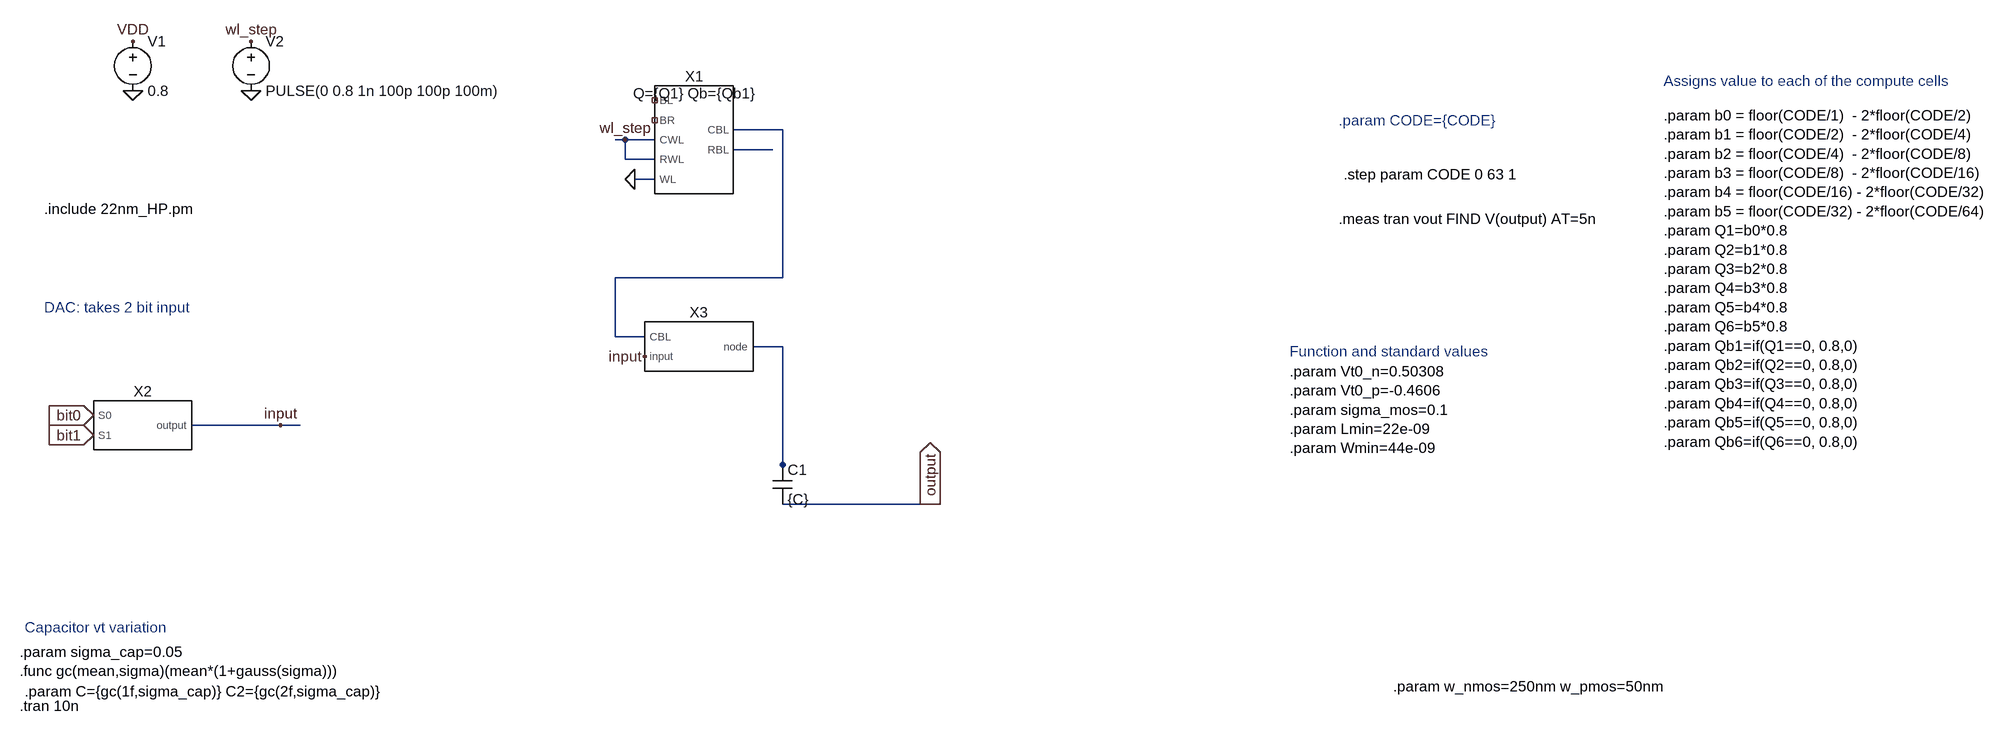
[diagram p0: schematic two_bit_weight_row.asc]
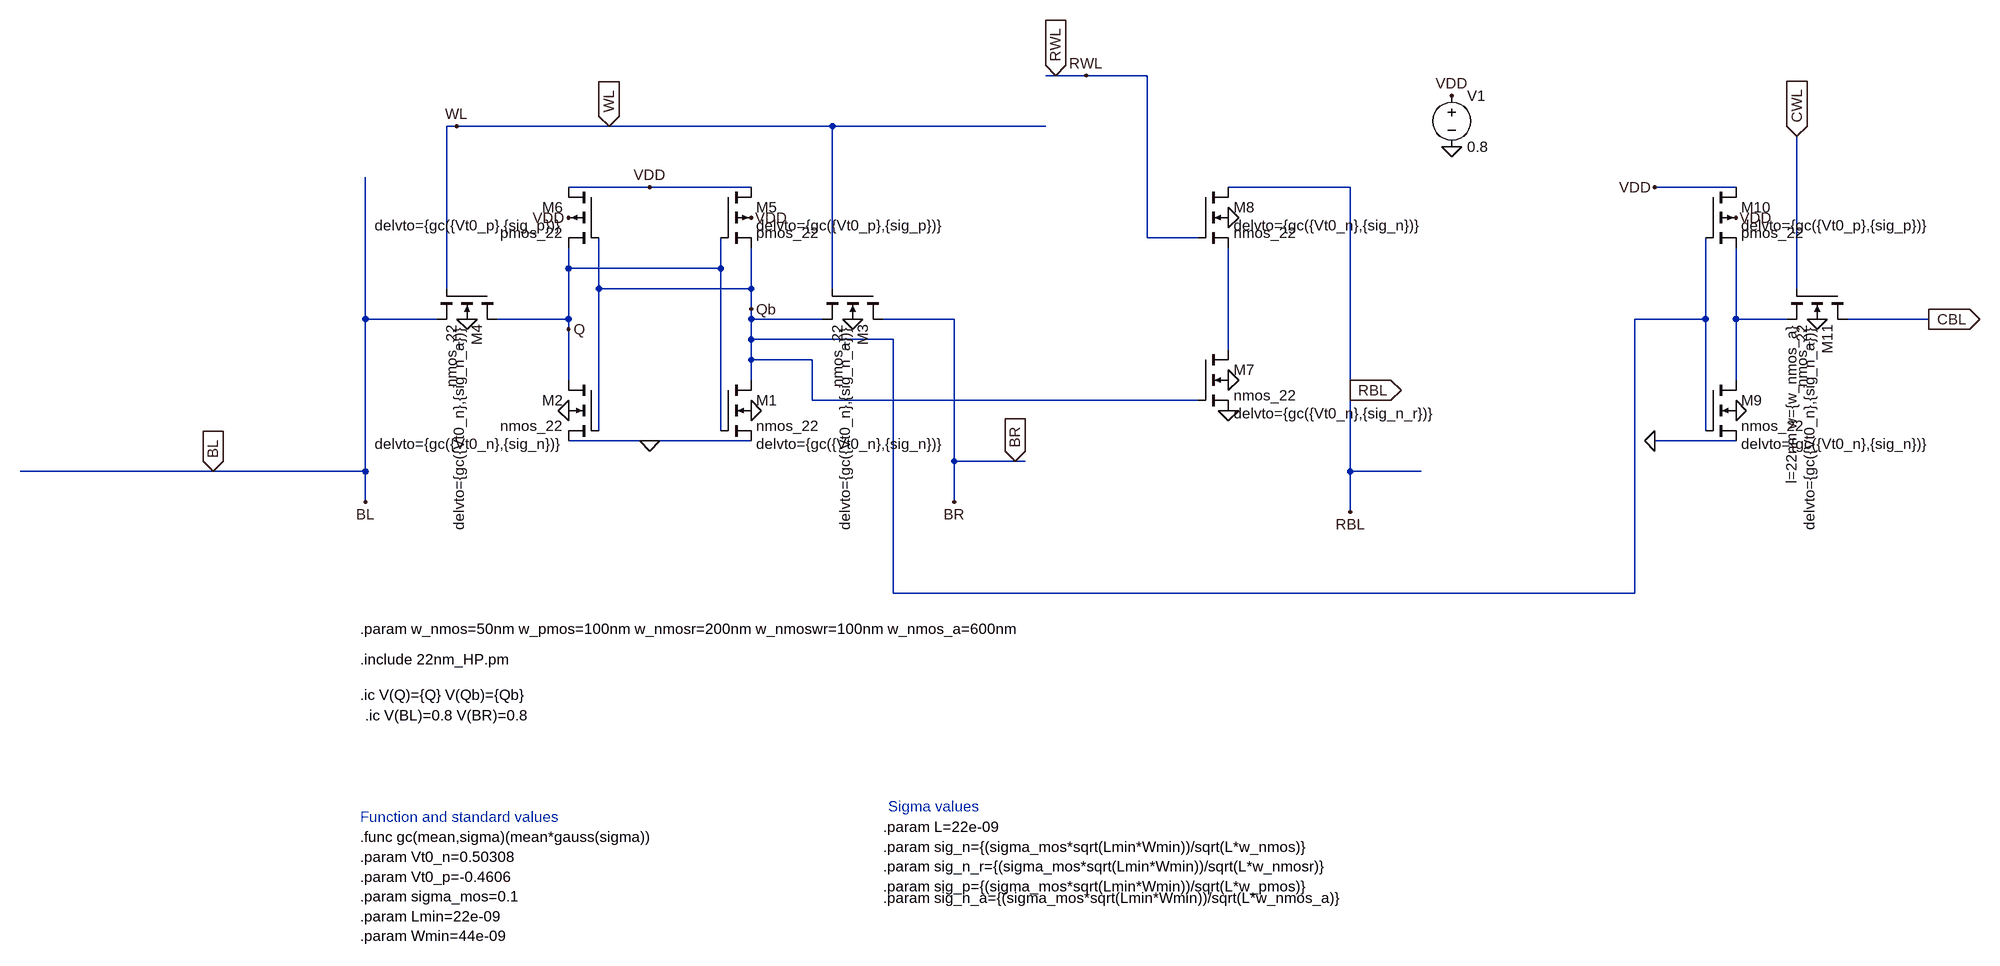
[diagram p1: sub-circuit vt_cell.asc]
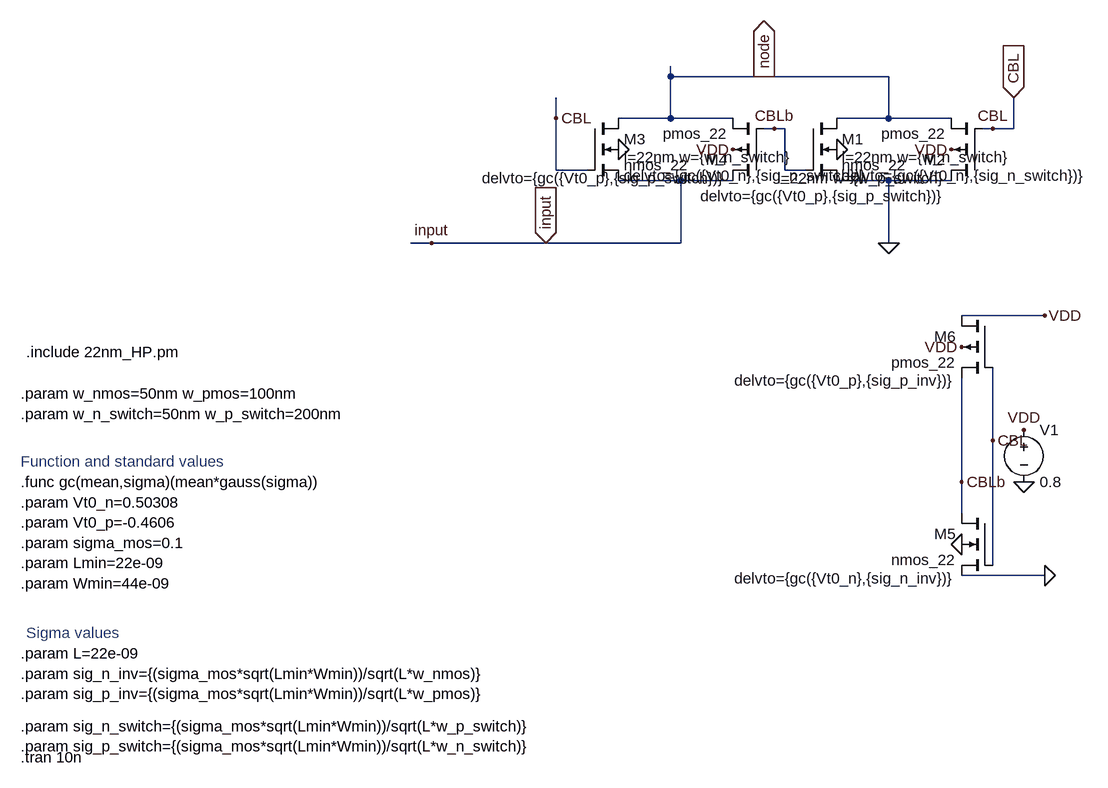
[diagram p2: sub-circuit transmissiongate_switch.asc]
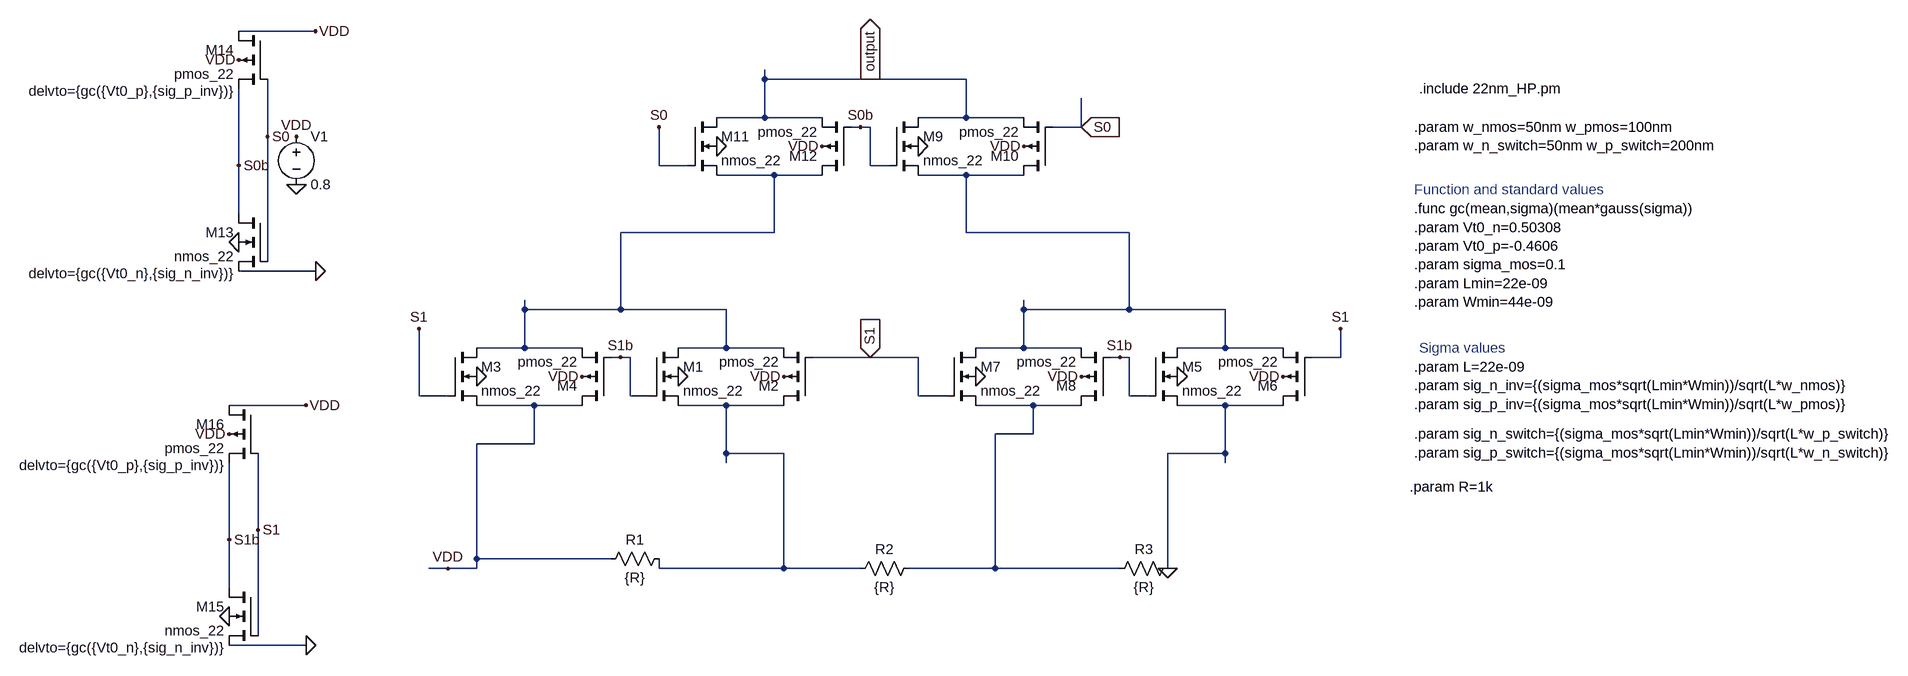
[diagram p3: sub-circuit dac.asc]
two_bit_weight_row.asc, the LTspice schematic file:
Version 4.1
SHEET 1 1952 760
WIRE -48 -192 -128 -192
WIRE -304 -176 -320 -176
WIRE -256 -176 -304 -176
WIRE -64 -160 -128 -160
WIRE -304 -144 -304 -176
WIRE -256 -144 -304 -144
WIRE -256 -112 -288 -112
WIRE -48 48 -48 -192
WIRE -48 48 -320 48
WIRE -320 144 -320 48
WIRE -272 144 -320 144
WIRE -48 160 -96 160
WIRE -864 288 -1008 288
WIRE -832 288 -864 288
WIRE -48 352 -48 160
WIRE -48 368 -48 352
WIRE 192 416 -48 416
WIRE 208 416 192 416
FLAG -288 -112 0
FLAG -304 -176 wl_step
FLAG -272 176 input
FLAG -912 -256 0
FLAG -912 -336 wl_step
FLAG -1104 -256 0
FLAG -1104 -336 VDD
FLAG 192 416 output
IOPIN 192 416 Out
FLAG -864 288 input
FLAG -1168 272 bit0
IOPIN -1168 272 In
FLAG -1168 304 bit1
IOPIN -1168 304 In
SYMBOL vt_cell -192 -176 R0
WINDOW 39 0 -60 Bottom 2
SYMATTR SpiceLine Q={Q1} Qb={Qb1}
SYMATTR InstName X1
SYMBOL transmissiongate_switch -192 160 R0
SYMATTR InstName X3
SYMBOL cap -64 416 M180
WINDOW 0 24 56 Left 2
WINDOW 3 24 8 Left 2
SYMATTR InstName C1
SYMATTR Value {C}
SYMBOL voltage -1104 -352 R0
WINDOW 123 0 0 Left 0
WINDOW 39 0 0 Left 0
SYMATTR InstName V1
SYMATTR Value 0.8
SYMBOL voltage -912 -352 R0
WINDOW 123 0 0 Left 0
WINDOW 39 0 0 Left 0
SYMATTR InstName V2
SYMATTR Value PULSE(0 0.8 1n 100p 100p 100m)
SYMBOL DAC -1088 288 R0
SYMATTR InstName X2
TEXT 1384 -216 Left 2 !.param b0 = floor(CODE/1)  - 2*floor(CODE/2)\n.param b1 = floor(CODE/2)  - 2*floor(CODE/4)\n.param b2 = floor(CODE/4)  - 2*floor(CODE/8)\n.param b3 = floor(CODE/8)  - 2*floor(CODE/16)\n.param b4 = floor(CODE/16) - 2*floor(CODE/32)\n.param b5 = floor(CODE/32) - 2*floor(CODE/64)\n.param Q1=b0*0.8\n.param Q2=b1*0.8\n.param Q3=b2*0.8\n.param Q4=b3*0.8\n.param Q5=b4*0.8\n.param Q6=b5*0.8\n.param Qb1=if(Q1==0, 0.8,0)\n.param Qb2=if(Q2==0, 0.8,0)\n.param Qb3=if(Q3==0, 0.8,0)\n.param Qb4=if(Q4==0, 0.8,0)\n.param Qb5=if(Q5==0, 0.8,0)\n.param Qb6=if(Q6==0, 0.8,0)
TEXT 856 -208 Left 2 ;.param CODE={CODE}
TEXT 1384 -272 Left 2 ;Assigns value to each of the compute cells
TEXT 864 -120 Left 2 !.step param CODE 0 63 1
TEXT 856 -48 Left 2 !.meas tran vout FIND V(output) AT=5n
TEXT -1248 96 Left 2 ;DAC: takes 2 bit input
TEXT -1280 720 Left 2 !.param C={gc(1f,sigma_cap)} C2={gc(2f,sigma_cap)}
TEXT -1248 -64 Left 2 !.include 22nm_HP.pm
TEXT -1288 656 Left 2 !.param sigma_cap=0.05\n.func gc(mean,sigma)(mean*(1+gauss(sigma)))
TEXT -1280 616 Left 2 ;Capacitor vt variation
TEXT 944 712 Left 2 !.param w_nmos=250nm w_pmos=50nm
TEXT 776 200 Left 2 !.param Vt0_n=0.50308\n.param Vt0_p=-0.4606\n.param sigma_mos=0.1\n.param Lmin=22e-09\n.param Wmin=44e-09
TEXT 776 168 Left 2 ;Function and standard values
TEXT -1288 744 Left 2 !.tran 10n

vt_cell.asc, the sub-circuit schematic file:
Version 4.1
SHEET 1 2080 848
WIRE 320 -528 304 -528
WIRE 368 -528 320 -528
WIRE 464 -528 368 -528
WIRE -624 -448 -640 -448
WIRE -384 -448 -624 -448
WIRE -32 -448 -384 -448
WIRE 304 -448 -32 -448
WIRE -320 -352 -448 -352
WIRE -160 -352 -320 -352
WIRE 784 -352 592 -352
WIRE 1392 -352 1264 -352
WIRE 464 -272 464 -528
WIRE 544 -272 464 -272
WIRE -448 -224 -448 -256
WIRE -208 -224 -208 -272
WIRE -208 -224 -448 -224
WIRE -640 -192 -640 -448
WIRE -400 -192 -400 -272
WIRE -160 -192 -160 -256
WIRE -160 -192 -400 -192
WIRE -32 -192 -32 -448
WIRE 1488 -192 1488 -432
WIRE -160 -160 -160 -192
WIRE -768 -144 -768 -368
WIRE -656 -144 -768 -144
WIRE -448 -144 -448 -224
WIRE -448 -144 -560 -144
WIRE -160 -144 -160 -160
WIRE -48 -144 -160 -144
WIRE 160 -144 48 -144
WIRE 1344 -144 1344 -272
WIRE 1344 -144 1232 -144
WIRE 1392 -144 1392 -256
WIRE 1472 -144 1392 -144
WIRE 1696 -144 1568 -144
WIRE -448 -128 -448 -144
WIRE -160 -112 -160 -144
WIRE 64 -112 -160 -112
WIRE 592 -96 592 -256
WIRE -160 -80 -160 -112
WIRE -64 -80 -160 -80
WIRE -448 -48 -448 -128
WIRE -160 -48 -160 -80
WIRE 1392 -48 1392 -144
WIRE 784 -32 784 -352
WIRE -64 -16 -64 -80
WIRE 544 -16 -64 -16
WIRE -400 32 -400 -192
WIRE -208 32 -208 -224
WIRE 1344 32 1344 -144
WIRE -320 48 -448 48
WIRE -160 48 -320 48
WIRE 1392 48 1264 48
WIRE 160 80 160 -144
WIRE 256 80 160 80
WIRE 272 80 256 80
WIRE -1008 96 -1312 96
WIRE -768 96 -768 -144
WIRE -768 96 -1008 96
WIRE 784 96 784 -32
WIRE 896 96 784 96
WIRE -768 144 -768 96
WIRE 160 144 160 80
WIRE 784 160 784 96
WIRE 64 288 64 -112
WIRE 1232 288 1232 -144
WIRE 1232 288 64 288
FLAG 944 -416 0
FLAG 944 -496 VDD
FLAG -320 -352 VDD
FLAG -448 -304 VDD
FLAG -160 -304 VDD
FLAG 0 -144 0
FLAG -160 0 0
FLAG -448 0 0
FLAG -608 -144 0
FLAG -768 144 BL
FLAG 160 144 BR
FLAG -624 -448 WL
FLAG 592 -48 0
FLAG 592 -304 0
FLAG 368 -528 RWL
FLAG 784 160 RBL
FLAG -160 -160 Qb
FLAG -448 -128 Q
FLAG 592 0 0
FLAG -320 48 0
FLAG -384 -448 WL
IOPIN -384 -448 In
FLAG 320 -528 RWL
IOPIN 320 -528 In
FLAG 784 -32 RBL
IOPIN 784 -32 Out
FLAG 1264 -352 VDD
FLAG 1392 -304 VDD
FLAG 1392 0 0
FLAG 1264 48 0
FLAG 1520 -144 0
FLAG 1488 -432 CWL
IOPIN 1488 -432 In
FLAG 1696 -144 CBL
IOPIN 1696 -144 Out
FLAG -1008 96 BL
IOPIN -1008 96 In
FLAG 256 80 BR
IOPIN 256 80 In
SYMBOL nmos4 -208 -48 R0
WINDOW 39 56 100 Left 2
SYMATTR SpiceLine delvto={gc({Vt0_n},{sig_n})}
SYMATTR InstName M1
SYMATTR Value nmos_22
SYMATTR Value2 l=22nm w={w_nmos}
SYMBOL nmos4 -400 -48 M0
WINDOW 39 56 100 Left 2
SYMATTR SpiceLine delvto={gc({Vt0_n},{sig_n})}
SYMATTR InstName M2
SYMATTR Value nmos_22
SYMATTR Value2 l=22nm w={w_nmos}
SYMBOL nmos4 48 -192 R90
WINDOW 39 56 60 Left 2
SYMATTR SpiceLine delvto={gc({Vt0_n},{sig_n_a})}
SYMATTR InstName M3
SYMATTR Value nmos_22
SYMATTR Value2 l=22nm w={w_nmos_a}
SYMBOL nmos4 -560 -192 R90
WINDOW 39 56 60 Left 2
SYMATTR SpiceLine delvto={gc({Vt0_n},{sig_n_a})}
SYMATTR InstName M4
SYMATTR Value nmos_22
SYMATTR Value2 l=22nm w={w_nmos_a}
SYMBOL pmos4 -208 -352 R0
WINDOW 39 56 60 Left 2
SYMATTR SpiceLine delvto={gc({Vt0_p},{sig_p})}
SYMATTR InstName M5
SYMATTR Value pmos_22
SYMATTR Value2 l=22nm w={w_pmos}
SYMBOL pmos4 -400 -352 M0
WINDOW 39 56 60 Left 2
SYMATTR SpiceLine delvto={gc({Vt0_p},{sig_p})}
SYMATTR InstName M6
SYMATTR Value pmos_22
SYMATTR Value2 l=22nm w={w_pmos}
SYMBOL voltage 944 -512 R0
WINDOW 123 0 0 Left 0
WINDOW 39 0 0 Left 0
SYMATTR InstName V1
SYMATTR Value 0.8
SYMBOL nmos4 544 -96 R0
WINDOW 39 56 100 Left 2
SYMATTR SpiceLine delvto={gc({Vt0_n},{sig_n_r})}
SYMATTR InstName M7
SYMATTR Value nmos_22
SYMATTR Value2 l=22nm w={w_nmosr}
SYMBOL nmos4 544 -352 R0
WINDOW 39 56 60 Left 2
SYMATTR SpiceLine delvto={gc({Vt0_n},{sig_n})}
SYMATTR InstName M8
SYMATTR Value nmos_22
SYMATTR Value2 l=22nm w={w_nmos}
SYMBOL nmos4 1344 -48 R0
WINDOW 39 56 100 Left 2
SYMATTR SpiceLine delvto={gc({Vt0_n},{sig_n})}
SYMATTR InstName M9
SYMATTR Value nmos_22
SYMATTR Value2 l=22nm w={w_nmos}
SYMBOL pmos4 1344 -352 R0
WINDOW 39 56 60 Left 2
SYMATTR SpiceLine delvto={gc({Vt0_p},{sig_p})}
SYMATTR InstName M10
SYMATTR Value pmos_22
SYMATTR Value2 l=22nm w={w_pmos}
SYMBOL nmos4 1568 -192 R90
WINDOW 39 56 60 Left 2
WINDOW 123 56 88 Left 2
SYMATTR SpiceLine delvto={gc({Vt0_n},{sig_n_a})}
SYMATTR Value2 l=22nm w={w_nmos_a}
SYMATTR InstName M11
SYMATTR Value nmos_22
TEXT -776 392 Left 2 !.include 22nm_HP.pm
TEXT -776 344 Left 2 !.param w_nmos=50nm w_pmos=100nm w_nmosr=200nm w_nmoswr=100nm w_nmos_a=600nm
TEXT -776 448 Left 2 !.ic V(Q)={Q} V(Qb)={Qb}
TEXT -776 672 Left 2 !.func gc(mean,sigma)(mean*gauss(sigma))\n.param Vt0_n=0.50308\n.param Vt0_p=-0.4606\n.param sigma_mos=0.1\n.param Lmin=22e-09\n.param Wmin=44e-09
TEXT 48 656 Left 2 !.param L=22e-09\n.param sig_n={(sigma_mos*sqrt(Lmin*Wmin))/sqrt(L*w_nmos)}\n.param sig_n_r={(sigma_mos*sqrt(Lmin*Wmin))/sqrt(L*w_nmosr)}\n.param sig_p={(sigma_mos*sqrt(Lmin*Wmin))/sqrt(L*w_pmos)}
TEXT -776 640 Left 2 ;Function and standard values
TEXT 56 624 Left 2 ;Sigma values
TEXT -768 480 Left 2 !.ic V(BL)=0.8 V(BR)=0.8
TEXT 48 768 Left 2 !.param sig_n_a={(sigma_mos*sqrt(Lmin*Wmin))/sqrt(L*w_nmos_a)}

transmissiongate_switch.asc, the sub-circuit schematic file:
Version 4.1
SHEET 1 888 868
WIRE 128 -240 128 -256
WIRE 272 -240 128 -240
WIRE 464 -240 272 -240
WIRE -48 -176 -48 -208
WIRE 128 -176 128 -240
WIRE 128 -176 48 -176
WIRE 224 -176 128 -176
WIRE 464 -176 464 -240
WIRE 464 -176 384 -176
WIRE 560 -176 464 -176
WIRE 288 -160 272 -160
WIRE 304 -160 288 -160
WIRE 624 -160 608 -160
WIRE 656 -160 656 -208
WIRE 656 -160 624 -160
WIRE -48 -96 -48 -176
WIRE 0 -96 -48 -96
WIRE 304 -96 304 -160
WIRE 336 -96 304 -96
WIRE 144 -80 48 -80
WIRE 224 -80 144 -80
WIRE 464 -80 384 -80
WIRE 560 -80 464 -80
WIRE -240 16 -272 16
WIRE -64 16 -240 16
WIRE 144 16 144 -80
WIRE 144 16 -64 16
WIRE 464 16 464 -80
WIRE 704 128 576 128
WIRE 624 320 624 208
WIRE 576 384 576 224
WIRE 576 432 576 384
WIRE 624 512 624 320
WIRE 704 528 576 528
FLAG 384 -128 0
FLAG 560 -128 VDD
FLAG 48 -128 0
FLAG 224 -128 VDD
FLAG 464 16 0
FLAG -240 16 input
FLAG 704 128 VDD
FLAG 576 176 VDD
FLAG 576 480 0
FLAG 704 528 0
FLAG 656 -208 CBL
IOPIN 656 -208 In
FLAG 624 -160 CBL
FLAG 624 320 CBL
FLAG -48 -176 CBL
FLAG 576 384 CBLb
FLAG 288 -160 CBLb
FLAG -64 16 input
IOPIN -64 16 In
FLAG 272 -240 node
IOPIN 272 -240 Out
FLAG 672 384 0
FLAG 672 304 VDD
SYMBOL nmos4 336 -176 R0
WINDOW 123 56 60 Left 2
WINDOW 39 56 88 Left 2
SYMATTR Value2 l=22nm w={w_n_switch}
SYMATTR SpiceLine delvto={gc({Vt0_n},{sig_n_switch})}
SYMATTR InstName M1
SYMATTR Value nmos_22
SYMBOL pmos4 608 -80 R180
WINDOW 123 56 4 Left 2
WINDOW 39 56 -24 Left 2
SYMATTR Value2 l=22nm w={w_p_switch}
SYMATTR SpiceLine delvto={gc({Vt0_p},{sig_p_switch})}
SYMATTR InstName M2
SYMATTR Value pmos_22
SYMBOL nmos4 0 -176 R0
WINDOW 123 56 60 Left 2
WINDOW 39 56 88 Left 2
SYMATTR Value2 l=22nm w={w_n_switch}
SYMATTR SpiceLine delvto={gc({Vt0_n},{sig_n_switch})}
SYMATTR InstName M3
SYMATTR Value nmos_22
SYMBOL pmos4 272 -80 R180
WINDOW 39 56 4 Left 2
SYMATTR SpiceLine delvto={gc({Vt0_p},{sig_p_switch})}
SYMATTR InstName M4
SYMATTR Value pmos_22
SYMATTR Value2 l=22nm w={w_p_switch}
SYMBOL nmos4 624 432 M0
WINDOW 39 56 100 Left 2
SYMATTR SpiceLine delvto={gc({Vt0_n},{sig_n_inv})}
SYMATTR InstName M5
SYMATTR Value nmos_22
SYMATTR Value2 l=22nm w={w_nmos}
SYMBOL pmos4 624 128 M0
WINDOW 39 56 100 Left 2
SYMATTR SpiceLine delvto={gc({Vt0_p},{sig_p_inv})}
SYMATTR InstName M6
SYMATTR Value pmos_22
SYMATTR Value2 l=22nm w={w_pmos}
SYMBOL voltage 672 288 R0
WINDOW 123 0 0 Left 0
WINDOW 39 0 0 Left 0
SYMATTR InstName V1
SYMATTR Value 0.8
TEXT -872 248 Left 2 !.param w_nmos=50nm w_pmos=100nm\n.param w_n_switch=50nm w_p_switch=200nm
TEXT -872 384 Left 2 !.func gc(mean,sigma)(mean*gauss(sigma))\n.param Vt0_n=0.50308\n.param Vt0_p=-0.4606\n.param sigma_mos=0.1\n.param Lmin=22e-09\n.param Wmin=44e-09
TEXT -872 648 Left 2 !.param L=22e-09\n.param sig_n_inv={(sigma_mos*sqrt(Lmin*Wmin))/sqrt(L*w_nmos)}\n.param sig_p_inv={(sigma_mos*sqrt(Lmin*Wmin))/sqrt(L*w_pmos)}
TEXT -872 352 Left 2 ;Function and standard values
TEXT -864 616 Left 2 ;Sigma values
TEXT -872 760 Left 2 !.param sig_n_switch={(sigma_mos*sqrt(Lmin*Wmin))/sqrt(L*w_p_switch)}\n.param sig_p_switch={(sigma_mos*sqrt(Lmin*Wmin))/sqrt(L*w_n_switch)}
TEXT -872 808 Left 2 !.tran 10n
TEXT -864 184 Left 2 !.include 22nm_HP.pm

dac.asc, the sub-circuit schematic file:
Version 4.1
SHEET 1 2632 1040
WIRE -528 -384 -656 -384
WIRE 352 -304 352 -320
WIRE 528 -304 352 -304
WIRE 688 -304 528 -304
WIRE 352 -240 352 -304
WIRE 352 -240 272 -240
WIRE 448 -240 352 -240
WIRE 688 -240 688 -304
WIRE 688 -240 608 -240
WIRE 784 -240 688 -240
WIRE 512 -224 496 -224
WIRE 528 -224 512 -224
WIRE 880 -224 880 -272
WIRE 880 -224 832 -224
WIRE -608 -208 -608 -304
WIRE -656 -160 -656 -288
WIRE 176 -160 176 -224
WIRE 224 -160 176 -160
WIRE 528 -160 528 -224
WIRE 560 -160 528 -160
WIRE 368 -144 272 -144
WIRE 448 -144 368 -144
WIRE 688 -144 608 -144
WIRE 784 -144 688 -144
WIRE -656 -80 -656 -160
WIRE 368 -48 368 -144
WIRE 368 -48 112 -48
WIRE 688 -48 688 -144
WIRE 960 -48 688 -48
WIRE -608 0 -608 -208
WIRE -528 16 -656 16
WIRE -48 80 -48 64
WIRE 112 80 112 -48
WIRE 112 80 -48 80
WIRE 288 80 112 80
WIRE 784 80 784 64
WIRE 960 80 960 -48
WIRE 960 80 784 80
WIRE 1120 80 960 80
WIRE -48 144 -48 80
WIRE -48 144 -128 144
WIRE 48 144 -48 144
WIRE 288 144 288 80
WIRE 288 144 208 144
WIRE 384 144 288 144
WIRE 784 144 784 80
WIRE 784 144 704 144
WIRE 880 144 784 144
WIRE 1120 144 1120 80
WIRE 1120 144 1040 144
WIRE 1216 144 1120 144
WIRE 112 160 96 160
WIRE 128 160 112 160
WIRE 528 160 432 160
WIRE 608 160 528 160
WIRE 944 160 928 160
WIRE 960 160 944 160
WIRE 1312 160 1312 112
WIRE 1312 160 1264 160
WIRE -224 224 -224 112
WIRE -176 224 -224 224
WIRE 128 224 128 160
WIRE 160 224 128 224
WIRE 608 224 608 160
WIRE 656 224 608 224
WIRE 960 224 960 160
WIRE 992 224 960 224
WIRE -544 240 -672 240
WIRE -32 240 -128 240
WIRE 48 240 -32 240
WIRE 288 240 208 240
WIRE 384 240 288 240
WIRE 800 240 704 240
WIRE 880 240 800 240
WIRE 1120 240 1040 240
WIRE 1216 240 1120 240
WIRE 800 288 800 240
WIRE 800 288 736 288
WIRE -32 304 -32 240
WIRE -32 304 -128 304
WIRE 288 320 288 240
WIRE 384 320 288 320
WIRE 1120 320 1120 240
WIRE 1120 320 1024 320
WIRE 288 336 288 320
WIRE 1120 336 1120 320
WIRE -624 448 -624 320
WIRE -672 464 -672 336
WIRE -128 496 -128 304
WIRE 96 496 -128 496
WIRE -176 512 -208 512
WIRE -128 512 -128 496
WIRE -128 512 -176 512
WIRE 176 512 176 496
WIRE 384 512 384 320
WIRE 384 512 176 512
WIRE 512 512 384 512
WIRE 736 512 736 288
WIRE 736 512 592 512
WIRE 944 512 736 512
WIRE 1024 512 1024 320
WIRE -672 544 -672 464
WIRE -624 624 -624 448
WIRE -544 640 -672 640
FLAG 208 192 0
FLAG 384 192 VDD
FLAG -128 192 0
FLAG 48 192 VDD
FLAG 1040 192 0
FLAG 1216 192 VDD
FLAG 704 192 0
FLAG 880 192 VDD
FLAG 608 -192 0
FLAG 784 -192 VDD
FLAG 272 -192 0
FLAG 448 -192 VDD
FLAG 880 -224 S0
IOPIN 880 -224 In
FLAG 528 160 S1
IOPIN 528 160 In
FLAG -528 -384 VDD
FLAG -656 -336 VDD
FLAG -656 -32 0
FLAG -528 16 0
FLAG -560 -128 0
FLAG -560 -208 VDD
FLAG -544 240 VDD
FLAG -672 288 VDD
FLAG -672 592 0
FLAG -544 640 0
FLAG -608 -208 S0
FLAG -656 -160 S0b
FLAG -672 464 S1b
FLAG -624 448 S1
FLAG 1024 512 0
FLAG 528 -304 output
IOPIN 528 -304 Out
FLAG 176 -224 S0
FLAG 512 -224 S0b
FLAG -224 112 S1
FLAG 1312 112 S1
FLAG 944 160 S1b
FLAG 112 160 S1b
FLAG -176 512 VDD
SYMBOL nmos4 160 144 R0
SYMATTR Value2 l=22nm w={w_n_switch} delvto={gc({Vt0_n},{sig_n_switch})}
SYMATTR InstName M1
SYMATTR Value nmos_22
SYMBOL pmos4 432 240 R180
SYMATTR Value2 l=22nm w={w_p_switch} delvto={gc({Vt0_p},{sig_p_switch})}
SYMATTR InstName M2
SYMATTR Value pmos_22
SYMBOL nmos4 -176 144 R0
SYMATTR Value2 l=22nm w={w_n_switch} delvto={gc({Vt0_n},{sig_n_switch})}
SYMATTR InstName M3
SYMATTR Value nmos_22
SYMBOL pmos4 96 240 R180
SYMATTR InstName M4
SYMATTR Value pmos_22
SYMATTR Value2 l=22nm w={w_p_switch} delvto={gc({Vt0_p},{sig_p_switch})}
SYMBOL nmos4 992 144 R0
SYMATTR Value2 l=22nm w={w_n_switch} delvto={gc({Vt0_n},{sig_n_switch})}
SYMATTR InstName M5
SYMATTR Value nmos_22
SYMBOL pmos4 1264 240 R180
SYMATTR Value2 l=22nm w={w_p_switch} delvto={gc({Vt0_p},{sig_p_switch})}
SYMATTR InstName M6
SYMATTR Value pmos_22
SYMBOL nmos4 656 144 R0
SYMATTR Value2 l=22nm w={w_n_switch} delvto={gc({Vt0_n},{sig_n_switch})}
SYMATTR InstName M7
SYMATTR Value nmos_22
SYMBOL pmos4 928 240 R180
SYMATTR InstName M8
SYMATTR Value pmos_22
SYMATTR Value2 l=22nm w={w_p_switch} delvto={gc({Vt0_p},{sig_p_switch})}
SYMBOL nmos4 560 -240 R0
SYMATTR Value2 l=22nm w={w_n_switch} delvto={gc({Vt0_n},{sig_n_switch})}
SYMATTR InstName M9
SYMATTR Value nmos_22
SYMBOL pmos4 832 -144 R180
SYMATTR Value2 l=22nm w={w_p_switch} delvto={gc({Vt0_p},{sig_p_switch})}
SYMATTR InstName M10
SYMATTR Value pmos_22
SYMBOL nmos4 224 -240 R0
SYMATTR Value2 l=22nm w={w_n_switch} delvto={gc({Vt0_n},{sig_n_switch})}
SYMATTR InstName M11
SYMATTR Value nmos_22
SYMBOL pmos4 496 -144 R180
SYMATTR InstName M12
SYMATTR Value pmos_22
SYMATTR Value2 l=22nm w={w_p_switch} delvto={gc({Vt0_p},{sig_p_switch})}
SYMBOL nmos4 -608 -80 M0
WINDOW 39 56 100 Left 2
SYMATTR SpiceLine delvto={gc({Vt0_n},{sig_n_inv})}
SYMATTR InstName M13
SYMATTR Value nmos_22
SYMATTR Value2 l=22nm w={w_nmos}
SYMBOL pmos4 -608 -384 M0
WINDOW 39 56 100 Left 2
SYMATTR SpiceLine delvto={gc({Vt0_p},{sig_p_inv})}
SYMATTR InstName M14
SYMATTR Value pmos_22
SYMATTR Value2 l=22nm w={w_pmos}
SYMBOL voltage -560 -224 R0
WINDOW 123 0 0 Left 0
WINDOW 39 0 0 Left 0
SYMATTR InstName V1
SYMATTR Value 0.8
SYMBOL nmos4 -624 544 M0
WINDOW 39 56 100 Left 2
SYMATTR SpiceLine delvto={gc({Vt0_n},{sig_n_inv})}
SYMATTR InstName M15
SYMATTR Value nmos_22
SYMATTR Value2 l=22nm w={w_nmos}
SYMBOL pmos4 -624 240 M0
WINDOW 39 56 100 Left 2
SYMATTR SpiceLine delvto={gc({Vt0_p},{sig_p_inv})}
SYMATTR InstName M16
SYMATTR Value pmos_22
SYMATTR Value2 l=22nm w={w_pmos}
SYMBOL res 192 480 R90
WINDOW 0 0 56 VBottom 2
WINDOW 3 32 56 VTop 2
SYMATTR InstName R1
SYMATTR Value {R}
SYMBOL res 608 496 R90
WINDOW 0 0 56 VBottom 2
WINDOW 3 32 56 VTop 2
SYMATTR InstName R2
SYMATTR Value {R}
SYMBOL res 1040 496 R90
WINDOW 0 0 56 VBottom 2
WINDOW 3 32 56 VTop 2
SYMATTR InstName R3
SYMATTR Value {R}
TEXT 1712 376 Left 2 !.param R=1k
TEXT 1720 -224 Left 2 !.param w_nmos=50nm w_pmos=100nm\n.param w_n_switch=50nm w_p_switch=200nm
TEXT 1720 -88 Left 2 !.func gc(mean,sigma)(mean*gauss(sigma))\n.param Vt0_n=0.50308\n.param Vt0_p=-0.4606\n.param sigma_mos=0.1\n.param Lmin=22e-09\n.param Wmin=44e-09
TEXT 1720 176 Left 2 !.param L=22e-09\n.param sig_n_inv={(sigma_mos*sqrt(Lmin*Wmin))/sqrt(L*w_nmos)}\n.param sig_p_inv={(sigma_mos*sqrt(Lmin*Wmin))/sqrt(L*w_pmos)}
TEXT 1720 -120 Left 2 ;Function and standard values
TEXT 1728 144 Left 2 ;Sigma values
TEXT 1720 288 Left 2 !.param sig_n_switch={(sigma_mos*sqrt(Lmin*Wmin))/sqrt(L*w_p_switch)}\n.param sig_p_switch={(sigma_mos*sqrt(Lmin*Wmin))/sqrt(L*w_n_switch)}
TEXT 1728 -288 Left 2 !.include 22nm_HP.pm

The netlist it stands for:
* two_bit_weight_row.asc
X§X1 NC_01 NC_02 wl_step wl_step 0 N001 N002 vt_cell params: Q={Q1} Qb={Qb1}
X§X3 N001 input N003 transmissiongate_switch
C1 output N003 {C}
V1 VDD 0 0.8
V2 wl_step 0 PULSE(0 0.8 1n 100p 100p 100m)
X§X2 bit0 bit1 input dac

* block symbol definitions
.subckt vt_cell BL BR CWL RWL WL CBL RBL
M1 Qb Q 0 0 nmos_22 l=22nm w={w_nmos} delvto={gc({Vt0_n},{sig_n})}
M2 Q Qb 0 0 nmos_22 l=22nm w={w_nmos} delvto={gc({Vt0_n},{sig_n})}
M3 BR WL Qb 0 nmos_22 l=22nm w={w_nmos_a} delvto={gc({Vt0_n},{sig_n_a})}
M4 Q WL BL 0 nmos_22 l=22nm w={w_nmos_a} delvto={gc({Vt0_n},{sig_n_a})}
M5 VDD Q Qb VDD pmos_22 l=22nm w={w_pmos} delvto={gc({Vt0_p},{sig_p})}
M6 VDD Qb Q VDD pmos_22 l=22nm w={w_pmos} delvto={gc({Vt0_p},{sig_p})}
V1 VDD 0 0.8
M7 N002 Qb 0 0 nmos_22 l=22nm w={w_nmosr} delvto={gc({Vt0_n},{sig_n_r})}
M8 RBL RWL N002 0 nmos_22 l=22nm w={w_nmos} delvto={gc({Vt0_n},{sig_n})}
M9 N001 Qb 0 0 nmos_22 l=22nm w={w_nmos} delvto={gc({Vt0_n},{sig_n})}
M10 VDD Qb N001 VDD pmos_22 l=22nm w={w_pmos} delvto={gc({Vt0_p},{sig_p})}
M11 CBL CWL N001 0 nmos_22 l=22nm w={w_nmos_a} delvto={gc({Vt0_n},{sig_n_a})}
.include 22nm_HP.pm
.param w_nmos=50nm w_pmos=100nm w_nmosr=200nm w_nmoswr=100nm w_nmos_a=600nm
.ic V(Q)={Q} V(Qb)={Qb}
.func gc(mean,sigma)(mean*gauss(sigma))
.param Vt0_n=0.50308
.param Vt0_p=-0.4606
.param sigma_mos=0.1
.param Lmin=22e-09
.param Wmin=44e-09
.param L=22e-09
.param sig_n={(sigma_mos*sqrt(Lmin*Wmin))/sqrt(L*w_nmos)}
.param sig_n_r={(sigma_mos*sqrt(Lmin*Wmin))/sqrt(L*w_nmosr)}
.param sig_p={(sigma_mos*sqrt(Lmin*Wmin))/sqrt(L*w_pmos)}
* Function and standard values
* Sigma values
.ic V(BL)=0.8 V(BR)=0.8
.param sig_n_a={(sigma_mos*sqrt(Lmin*Wmin))/sqrt(L*w_nmos_a)}
.ends vt_cell

.subckt transmissiongate_switch CBL input node
M1 node CBLb 0 0 nmos_22 l=22nm w={w_n_switch} delvto={gc({Vt0_n},{sig_n_switch})}
M2 0 CBL node VDD pmos_22 l=22nm w={w_p_switch} delvto={gc({Vt0_p},{sig_p_switch})}
M3 node CBL input 0 nmos_22 l=22nm w={w_n_switch} delvto={gc({Vt0_n},{sig_n_switch})}
M4 input CBLb node VDD pmos_22 l=22nm w={w_p_switch} delvto={gc({Vt0_p},{sig_p_switch})}
M5 CBLb CBL 0 0 nmos_22 l=22nm w={w_nmos} delvto={gc({Vt0_n},{sig_n_inv})}
M6 VDD CBL CBLb VDD pmos_22 l=22nm w={w_pmos} delvto={gc({Vt0_p},{sig_p_inv})}
V1 VDD 0 0.8
.param w_nmos=50nm w_pmos=100nm
.param w_n_switch=50nm w_p_switch=200nm
.func gc(mean,sigma)(mean*gauss(sigma))
.param Vt0_n=0.50308
.param Vt0_p=-0.4606
.param sigma_mos=0.1
.param Lmin=22e-09
.param Wmin=44e-09
.param L=22e-09
.param sig_n_inv={(sigma_mos*sqrt(Lmin*Wmin))/sqrt(L*w_nmos)}
.param sig_p_inv={(sigma_mos*sqrt(Lmin*Wmin))/sqrt(L*w_pmos)}
* Function and standard values
* Sigma values
.param sig_n_switch={(sigma_mos*sqrt(Lmin*Wmin))/sqrt(L*w_p_switch)}
.param sig_p_switch={(sigma_mos*sqrt(Lmin*Wmin))/sqrt(L*w_n_switch)}
.tran 10n
.include 22nm_HP.pm
.ends transmissiongate_switch

.subckt dac S0 S1 output
M1 N001 S1b N003 0 nmos_22 l=22nm w={w_n_switch} delvto={gc({Vt0_n},{sig_n_switch})}
M2 N003 S1 N001 VDD pmos_22 l=22nm w={w_p_switch} delvto={gc({Vt0_p},{sig_p_switch})}
M3 N001 S1 VDD 0 nmos_22 l=22nm w={w_n_switch} delvto={gc({Vt0_n},{sig_n_switch})}
M4 VDD S1b N001 VDD pmos_22 l=22nm w={w_p_switch} delvto={gc({Vt0_p},{sig_p_switch})}
M5 N002 S1b 0 0 nmos_22 l=22nm w={w_n_switch} delvto={gc({Vt0_n},{sig_n_switch})}
M6 0 S1 N002 VDD pmos_22 l=22nm w={w_p_switch} delvto={gc({Vt0_p},{sig_p_switch})}
M7 N002 S1 N004 0 nmos_22 l=22nm w={w_n_switch} delvto={gc({Vt0_n},{sig_n_switch})}
M8 N004 S1b N002 VDD pmos_22 l=22nm w={w_p_switch} delvto={gc({Vt0_p},{sig_p_switch})}
M9 output S0b N002 0 nmos_22 l=22nm w={w_n_switch} delvto={gc({Vt0_n},{sig_n_switch})}
M10 N002 S0 output VDD pmos_22 l=22nm w={w_p_switch} delvto={gc({Vt0_p},{sig_p_switch})}
M11 output S0 N001 0 nmos_22 l=22nm w={w_n_switch} delvto={gc({Vt0_n},{sig_n_switch})}
M12 N001 S0b output VDD pmos_22 l=22nm w={w_p_switch} delvto={gc({Vt0_p},{sig_p_switch})}
M13 S0b S0 0 0 nmos_22 l=22nm w={w_nmos} delvto={gc({Vt0_n},{sig_n_inv})}
M14 VDD S0 S0b VDD pmos_22 l=22nm w={w_pmos} delvto={gc({Vt0_p},{sig_p_inv})}
V1 VDD 0 0.8
M15 S1b S1 0 0 nmos_22 l=22nm w={w_nmos} delvto={gc({Vt0_n},{sig_n_inv})}
M16 VDD S1 S1b VDD pmos_22 l=22nm w={w_pmos} delvto={gc({Vt0_p},{sig_p_inv})}
R1 N003 VDD {R}
R2 N004 N003 {R}
R3 0 N004 {R}
.param R=1k
.param w_nmos=50nm w_pmos=100nm
.param w_n_switch=50nm w_p_switch=200nm
.func gc(mean,sigma)(mean*gauss(sigma))
.param Vt0_n=0.50308
.param Vt0_p=-0.4606
.param sigma_mos=0.1
.param Lmin=22e-09
.param Wmin=44e-09
.param L=22e-09
.param sig_n_inv={(sigma_mos*sqrt(Lmin*Wmin))/sqrt(L*w_nmos)}
.param sig_p_inv={(sigma_mos*sqrt(Lmin*Wmin))/sqrt(L*w_pmos)}
* Function and standard values
* Sigma values
.param sig_n_switch={(sigma_mos*sqrt(Lmin*Wmin))/sqrt(L*w_p_switch)}
.param sig_p_switch={(sigma_mos*sqrt(Lmin*Wmin))/sqrt(L*w_n_switch)}
.include 22nm_HP.pm
.ends dac

.model NMOS NMOS
.model PMOS PMOS
.lib standard.mos
.param b0 = floor(CODE/1)  - 2*floor(CODE/2)
.param b1 = floor(CODE/2)  - 2*floor(CODE/4)
.param b2 = floor(CODE/4)  - 2*floor(CODE/8)
.param b3 = floor(CODE/8)  - 2*floor(CODE/16)
.param b4 = floor(CODE/16) - 2*floor(CODE/32)
.param b5 = floor(CODE/32) - 2*floor(CODE/64)
.param Q1=b0*0.8
.param Q2=b1*0.8
.param Q3=b2*0.8
.param Q4=b3*0.8
.param Q5=b4*0.8
.param Q6=b5*0.8
.param Qb1=if(Q1==0, 0.8,0)
.param Qb2=if(Q2==0, 0.8,0)
.param Qb3=if(Q3==0, 0.8,0)
.param Qb4=if(Q4==0, 0.8,0)
.param Qb5=if(Q5==0, 0.8,0)
.param Qb6=if(Q6==0, 0.8,0)
* .param CODE={CODE}
* Assigns value to each of the compute cells
.step param CODE 0 63 1
.meas tran vout FIND V(output) AT=5n
* DAC: takes 2 bit input
.param C={gc(1f,sigma_cap)} C2={gc(2f,sigma_cap)}
.include 22nm_HP.pm
.param sigma_cap=0.05
.func gc(mean,sigma)(mean*(1+gauss(sigma)))
* Capacitor vt variation
.param w_nmos=250nm w_pmos=50nm
.param Vt0_n=0.50308
.param Vt0_p=-0.4606
.param sigma_mos=0.1
.param Lmin=22e-09
.param Wmin=44e-09
* Function and standard values
.tran 10n
.backanno
.end